# Altium schematic sheet S2_Power.SchDoc
size 420 x 297 mm; SheetNumber: 2; SheetTotal: 7
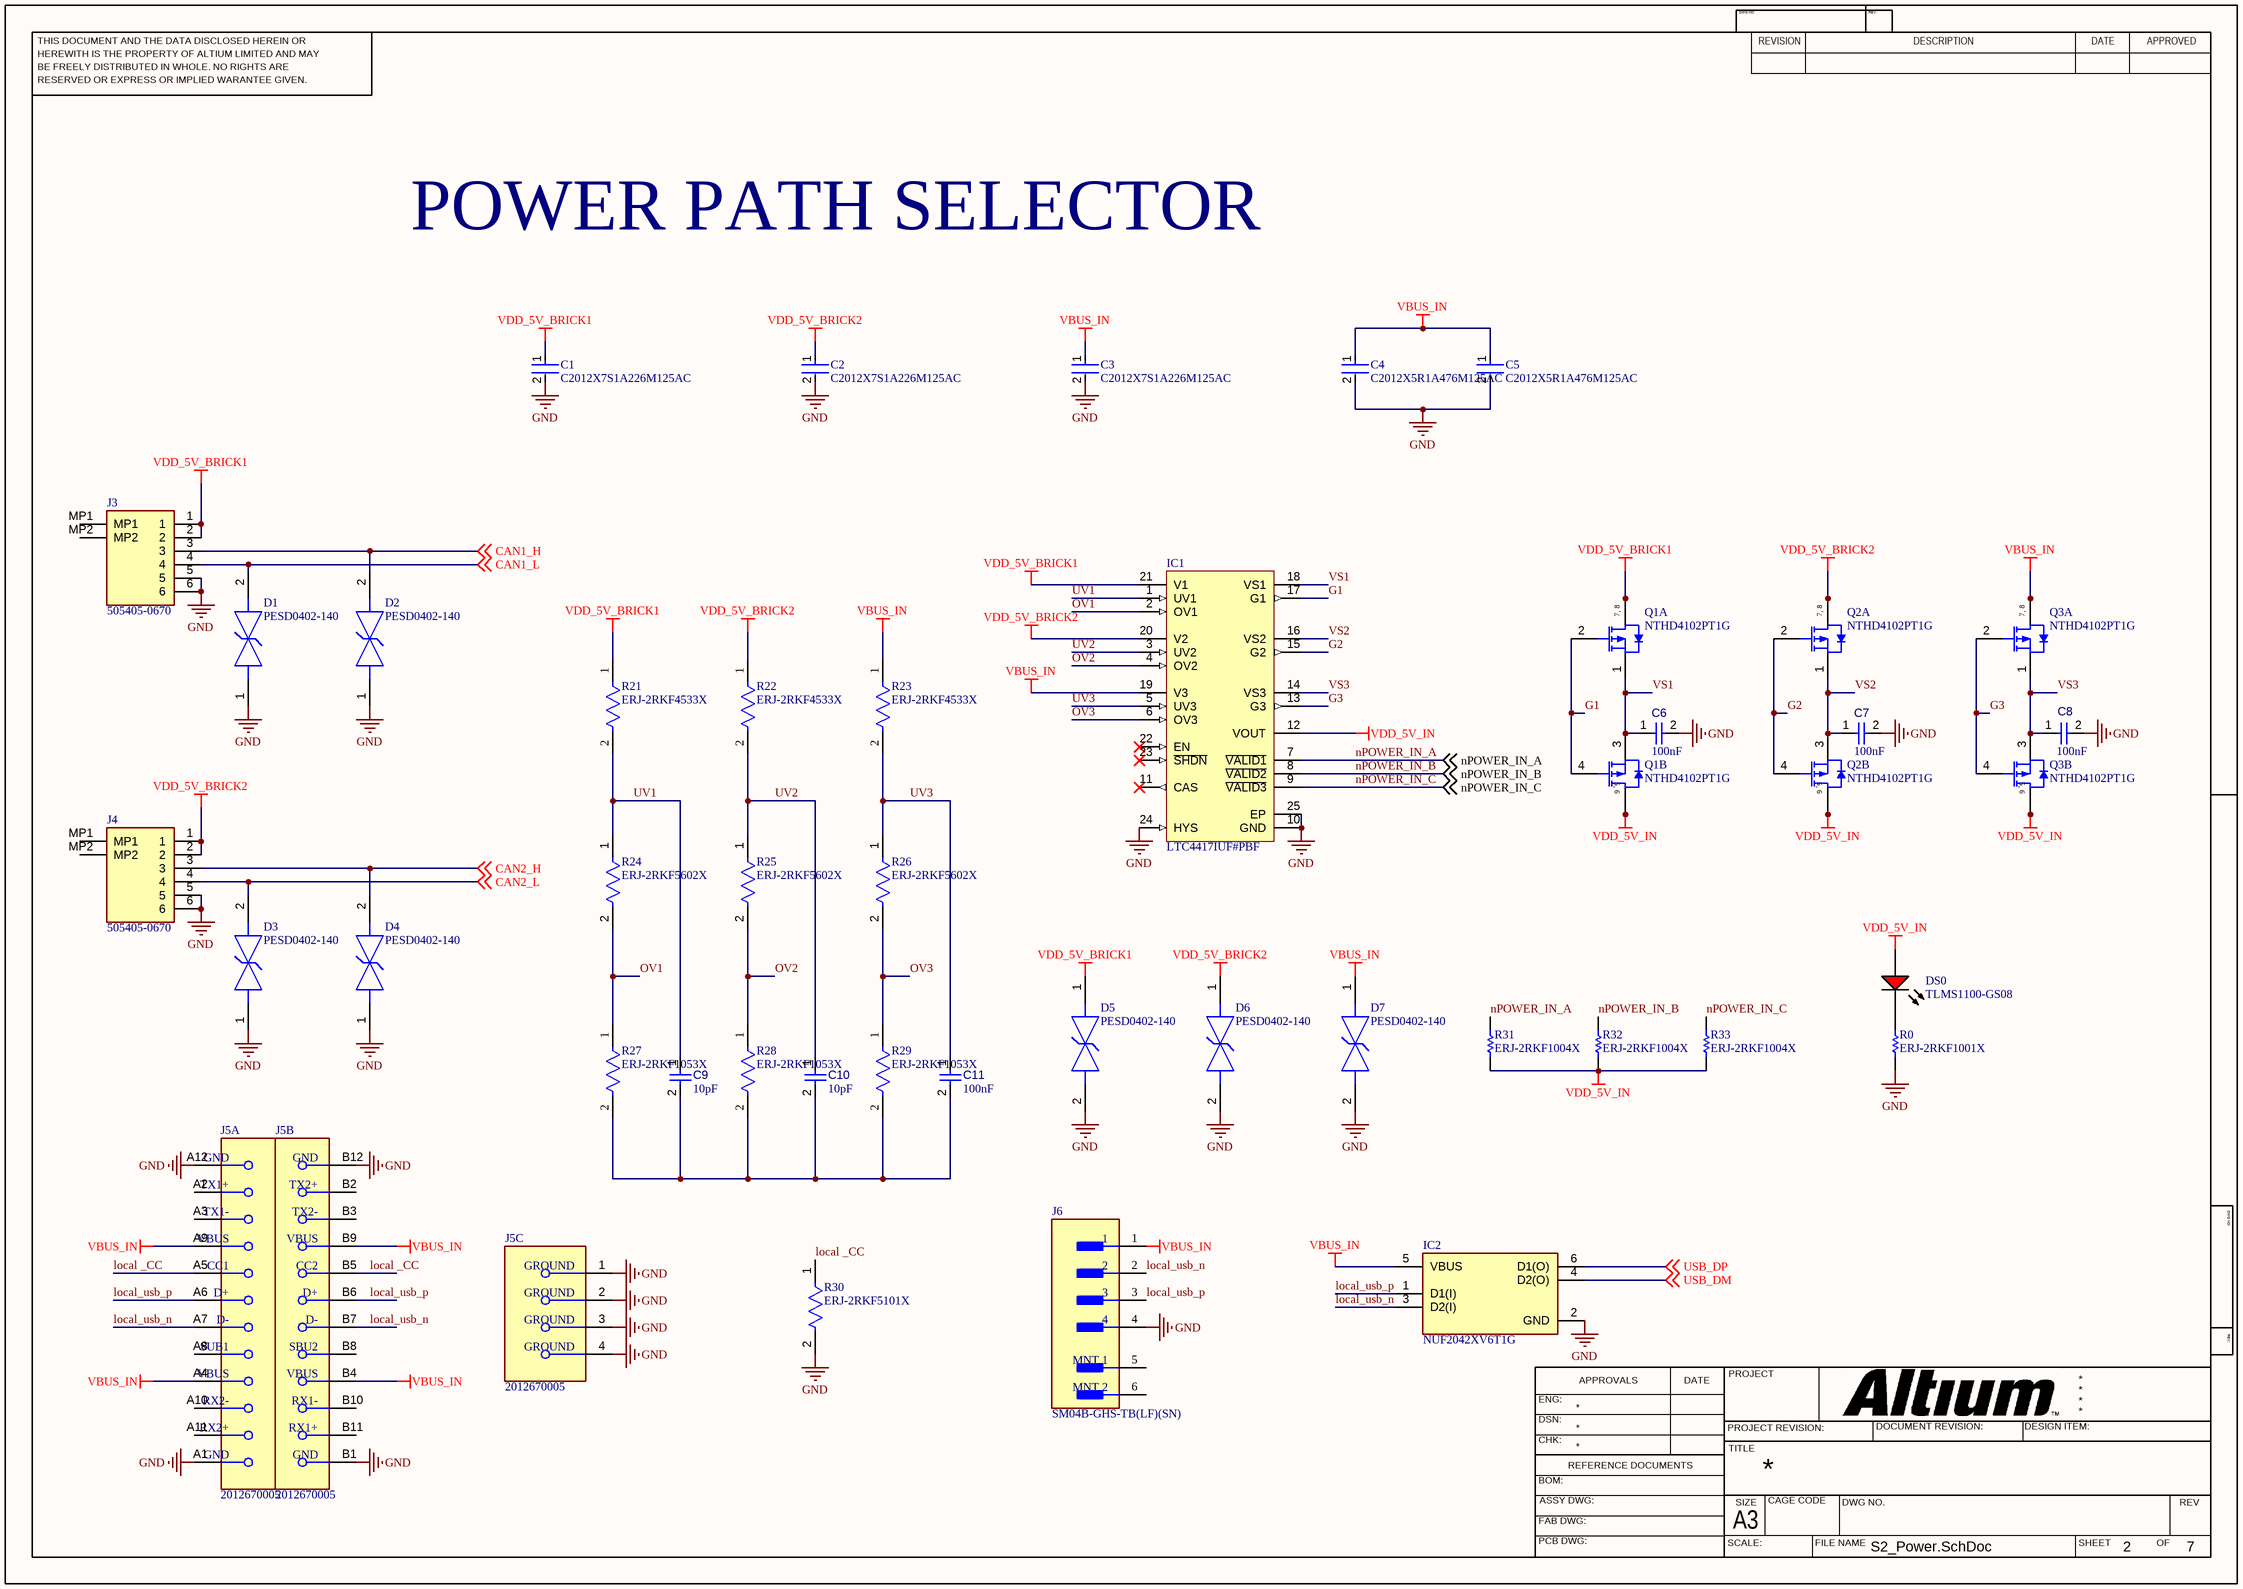
[diagram p0: S2_Power.SchDoc]

## Parts
C1  C2012X7S1A226M125AC  [FP-C2012-125-0_2-IPC_B]
C2  C2012X7S1A226M125AC  [FP-C2012-125-0_2-IPC_B]
C3  C2012X7S1A226M125AC  [FP-C2012-125-0_2-IPC_B]
C4  C2012X5R1A476M125AC  [FP-C2012-125-0_2-IPC_B]
C5  C2012X5R1A476M125AC  [FP-C2012-125-0_2-IPC_B]
C6  value 100nF  [CAPC0402(1005)60_L]  (hidden comment: Capacitor 100nF +/-20% 25V 0402)
C7  value 100nF  [CAPC0402(1005)60_L]  (hidden comment: Capacitor 100nF +/-20% 25V 0402)
C8  value 100nF  [CAPC0402(1005)60_L]  (hidden comment: Capacitor 100nF +/-20% 25V 0402)
C9  value 10pF  [CAPC1608X87X35NL15T15]  (hidden comment: Capacitor 10 pF +/- 0.25 pF 50 V 0603)
C10  value 10pF  [CAPC1608X87X35NL15T15]  (hidden comment: Capacitor 10 pF +/- 0.25 pF 50 V 0603)
C11  value 100nF  [CAPC0402(1005)60_L]  (hidden comment: Capacitor 100nF +/-20% 25V 0402)
D1  PESD0402-140  [FP-PESD0402-MFG]
D2  PESD0402-140  [FP-PESD0402-MFG]
D3  PESD0402-140  [FP-PESD0402-MFG]
D4  PESD0402-140  [FP-PESD0402-MFG]
D5  PESD0402-140  [FP-PESD0402-MFG]
D6  PESD0402-140  [FP-PESD0402-MFG]
D7  PESD0402-140  [FP-PESD0402-MFG]
DS0  TLMS1100-GS08  [VISH-TLMX1100_V]
IC1  LTC4417IUF#PBF  [LT-UF-24_N]
IC2  NUF2042XV6T1G  [FP-463A-MFG]
J3  505405-0670  [5054050670]
J4  505405-0670  [5054050670]
J5  2012670005  [FP-2012670005-MFG]  (parts A,B,C of 3)
J6  SM04B-GHS-TB(LF)(SN)  [FP-SM04B-GHS-TB_LF_SN-MFG]
Q1  NTHD4102PT1G  [ONSC-CHIPFET-8-1206A-03_S2_V]  (parts A,B of 2)
Q2  NTHD4102PT1G  [ONSC-CHIPFET-8-1206A-03_S2_V]  (parts A,B of 2)
Q3  NTHD4102PT1G  [ONSC-CHIPFET-8-1206A-03_S2_V]  (parts A,B of 2)
R0  ERJ-2RKF1001X  [RESC1005X40X25NL05T05]
R21  ERJ-2RKF4533X  [FP-ERJ2RK-MFG]
R22  ERJ-2RKF4533X  [FP-ERJ2RK-MFG]
R23  ERJ-2RKF4533X  [FP-ERJ2RK-MFG]
R24  ERJ-2RKF5602X  [FP-ERJ2R-IPC_A]
R25  ERJ-2RKF5602X  [FP-ERJ2R-IPC_A]
R26  ERJ-2RKF5602X  [FP-ERJ2R-IPC_A]
R27  ERJ-2RKF1053X  [FP-ERJ2RK-MFG]
R28  ERJ-2RKF1053X  [FP-ERJ2RK-MFG]
R29  ERJ-2RKF1053X  [FP-ERJ2RK-MFG]
R30  ERJ-2RKF5101X  [FP-ERJ2RK-IPC_A]
R31  ERJ-2RKF1004X  [RESC1005X40X25LL05T05]
R32  ERJ-2RKF1004X  [RESC1005X40X25LL05T05]
R33  ERJ-2RKF1004X  [RESC1005X40X25LL05T05]

## Nets
GND: C1.2 C2.2 C3.2 C4.2 C5.2 C6.2 C7.2 C8.2 D1.1 D2.1 D3.1 D4.1 D5.2 D6.2 D7.2 IC1.10(GND) IC1.24(HYS) IC1.25(EP) IC2.2(GND) J3.5 J3.6 J4.5 J4.6 J5.1(GROUND) J5.2(GROUND) J5.3(GROUND) J5.4(GROUND) J5.A1(GND) J5.A12(GND) J5.B1(GND) J5.B12(GND) J6.4 R0.1 R30.2
VBUS_IN: C3.1 C4.1 C5.1 D7.1 IC1.19(V3) IC2.5(VBUS) J5.A4(VBUS) J5.A9(VBUS) J5.B4(VBUS) J5.B9(VBUS) J6.1 Q3.7(D1) Q3.8(D1) R23.1
VDD_5V_BRICK1: C1.1 D5.1 IC1.21(V1) J3.1 J3.2 Q1.7(D1) Q1.8(D1) R21.1
VDD_5V_BRICK2: C2.1 D6.1 IC1.20(V2) J4.1 J4.2 Q2.7(D1) Q2.8(D1) R22.1
VDD_5V_IN: DS0.1(A) IC1.12(VOUT) Q1.5(D2) Q1.6(D2) Q2.5(D2) Q2.6(D2) Q3.5(D2) Q3.6(D2) R31.1 R32.1 R33.1
CAN1_H: D2.2 J3.3 ; off-sheet CAN1_H
CAN1_L: D1.2 J3.4 ; off-sheet CAN1_L
CAN2_H: D4.2 J4.3 ; off-sheet CAN2_H
CAN2_L: D3.2 J4.4 ; off-sheet CAN2_L
G1: IC1.17(G1) Q1.2(G1) Q1.4(G2)
G2: IC1.15(G2) Q2.2(G1) Q2.4(G2)
G3: IC1.13(G3) Q3.2(G1) Q3.4(G2)
local _CC: J5.A5(CC1) J5.B5(CC2) R30.1
local_usb_n: IC2.3(D2(I)) J5.A7(D-) J5.B7(D-) J6.2
local_usb_p: IC2.1(D1(I)) J5.A6(D+) J5.B6(D+) J6.3
nPOWER_IN_A: IC1.7(~{VALID1}) R31.2 ; off-sheet nPOWER_IN_A
nPOWER_IN_B: IC1.8(~{VALID2}) R32.2 ; off-sheet nPOWER_IN_B
nPOWER_IN_C: IC1.9(~{VALID3}) R33.2 ; off-sheet nPOWER_IN_C
OV1: IC1.2(OV1) R24.2 R27.1
OV2: IC1.4(OV2) R25.2 R28.1
OV3: IC1.6(OV3) R26.2 R29.1
USB_DM: IC2.4(D2(O)) ; off-sheet USB_DM
USB_DP: IC2.6(D1(O)) ; off-sheet USB_DP
UV1: C9.1 IC1.1(UV1) R21.2 R24.1
UV2: C10.1 IC1.3(UV2) R22.2 R25.1
UV3: C11.1 IC1.5(UV3) R23.2 R26.1
VS1: C6.1 IC1.18(VS1) Q1.1(S1) Q1.3(S2)
VS2: C7.1 IC1.16(VS2) Q2.1(S1) Q2.3(S2)
VS3: C8.1 IC1.14(VS3) Q3.1(S1) Q3.3(S2)
NetC9_2: C9.2 C10.2 C11.2 R27.2 R28.2 R29.2
NetDS0_2: DS0.2(K) R0.2

Not connected (* = marked no-connect by the designer): IC1 11(CAS)* 22(EN)* 23(~{SHDN})*; J3 MP1 MP2; J4 MP1 MP2; J5 A2(TX1+) A3(TX1-) A8(SUB1) A10(RX2-) A11(RX2+) B2(TX2+) B3(TX2-) B8(SBU2) B10(RX1-) B11(RX1+); J6 5(MNT_1) 6(MNT_2)

## Notes on the sheet
- POWER PATH SELECTOR
- THIS DOCUMENT AND THE DATA DISCLOSED HEREIN OR
- HEREWITH IS THE PROPERTY OF ALTIUM LIMITED AND MAY
- DWG NO:
- REVISION
- REV:
- DESCRIPTION
- DATE
- APPROVED
- BE FREELY DISTRIBUTED IN WHOLE. NO RIGHTS ARE
- RESERVED OR EXPRESS OR IMPLIED WARANTEE GIVEN.
- ENG:
- APPROVALS
- PROJECT
- DSN:
- CHK:
- REFERENCE DOCUMENTS
- PROJECT REVISION:
- TITLE
- DOCUMENT REVISION:
- DESIGN ITEM:
- BOM:
- FAB DWG:
- PCB DWG:
- ASSY DWG:
- SCALE:
- A3
- SIZE
- CAGE CODE
- FILE NAME
- DWG NO.
- SHEET
- OF
- REV
- (in symbol CMP-1058-00037-1, part A) 7, 8
- (in symbol CMP-1058-00037-1, part B) 5, 6

## Library data of the parts
C1-C3 = CMP-08246-005250-1: Multilayer Ceramic Capacitors 22μF ±20% 10V X7S SMD 0805; Capacitance: 22uF; Height: 1.25mm; Case Code (Metric): 2012; Mount: Surface Mount; RoHS Compliant: Yes; Dielectric Material: Ceramic; Package Quantity: 2000; Tolerance: 20%; Min Operating Temperature: -55°C; REACH SVHC: No SVHC; Weight: 0.000194oz; Voltage Rating: 10V; Thickness: 0.057inch; Series: C; Termination: SMD/SMT; Length: 0.079inch; Max Operating Temperature: 125°C; Width: 1.25mm; Packaging: Tape and Reel; Dielectric: X7S; Case Code (Imperial): 0805; Voltage Rating (DC): 10V; Lead Free: Lead Free; Case/Package: 0805
C4 C5 = CMP-2000-05451-2: Multilayer Ceramic Capacitors 47μF ±20% 10V X5R SMD 0805; Capacitance: 47uF; RoHS Compliant: Yes; Dielectric: X5R; Case Code (Imperial): 0805; Min Operating Temperature: -55°C; Length: 2mm; Voltage Rating: 10V; Lead Free: Lead Free; Weight: 0.000194oz; Resistor Type: Ceramic; Dielectric Material: Ceramic; Max Operating Temperature: 85°C; Height: 1.25mm; Width: 0.049inch; Depth: 1.25mm; Termination: SMD/SMT; Case/Package: 0805; Voltage Rating (DC): 10V; Voltage: 10V; Thickness: 0.057inch; Tolerance: 20%; REACH SVHC: No SVHC; Package Quantity: 1; Series: C; Case Code (Metric): 2012; Mount: Surface Mount; Packaging: Tape and Reel
C6-C8 C11 = CMP-001-00065-4: Chip Capacitor, 100nF +/-20%, 25V, 0402, Thickness 0.6 mm; Tolerance: 10%; Max Operating Temperature: 85°C; Min Operating Temperature: -55°C; Pins: 2; Voltage Rating: 25V; Mounting Technology: SMT; Case/Package: 0402
C9 C10 = CMP-001-00012-6: Chip Capacitor, 10 pF, +/- 0.25 pF, 50 V, 0603 (1608 Metric); Tolerance: 0.25%; Capacitor Type: Ceramic; Voltage Rating: 50V; Max Operating Temperature: 125°C; RoHS Compliant: True; Mounting Technology: SM; Pins: 2; Case/Package: 0603; Min Operating Temperature: -55°C
D1-D7 = CMP-08607-000011-1: TVS DIODE 14V 40V 0402; Manufacturer: Littelfuse Inc.; Automotive Grade: Grade 1; Capacitance: 0.25pF; Value: 0.25pF; Direction: Bidirectional; Number Of Channels: 1; Temperature Range Low: -55°C; Lead Free: Yes; Temperature: -55°C to +125°C; Digikey Description: TVS DIODE 14V 40V 0402; Automotive: Yes; Device Class L2: TVS Diodes; Reverse Standoff Voltage: 14V; Device Class L1: Circuit Protection; Ipc Land Pattern Name: DIOC10050X33; Manufacturer Part Number: PESD0402-140; Breakdown Voltage: 14V; Height: 0.43mm; Clamping Voltage: 40V; RoHS: TRUE; Temperature Range High: +125°C; Device Class L3: unset; Octopart: https://octopart.com/pesd0402-140-littelfuse-74215061; Package: PESD0402; ComponentLink2URL: https://www.littelfuse.com/~/media/electronics/datasheets/polymer_esd_suppressors/littelfuse_polymer_esd_suppressor_pesd_catalog_datasheet.pdf.pdf; Category: Diode; ComponentLink2Description: Datasheet
DS0 = CMP-1666-00027-1: LED, RED, 2.1 V, -40 to 100 degC, 2-Pin SMD (0603), RoHS, Tape and Reel; Type (Capacitors): C0G; Resistance: 100000000000 Ohm; Capacitance: 12 pF; Voltage Rating: 50 V; Tolerance: 5%; Min Operating Temperature: -55degC; REACH SVHC: No SVHC; ComponentLink2Description: Datasheet; ComponentLink1URL: http://www.vishay.com/; Width: 0.8 mm; Package Quantity: 4000; PackageReference: TLMX1100; ComponentLink2URL: http://www.vishay.com/docs/83173/tlmb1100.pdf; Case/Package: 0603; Case Code (Metric): 1608; Packaging: Tape and Reel; Pins: 2; ComponentLink1Description: Manufacturer URL; Max Operating Temperature: 125degC; Height: 0.8 mm; Length: 1.6 mm; Mount: Surface Mount; PackageDescription: 2-Pin Surface Mount Device, Body 1.6 x 0.8 mm; DatasheetVersion: Rev. 2.7, 03/2016; Case Code (Imperial): 0603; Voltage Rating (DC): 50 V; RoHSCompliant: True; Radiation Hardening: No
IC1 = CMP-0479-00652-1: Prioritized PowerPath Controller, 2.5 to 36 V Vin, 24-pin QFN (UF-24), -40 to 85 degC, Pb-Free; Manufacturer: Linear Technology; Ideal Diode: Triple, External, P-Channel; ComponentLink3URL: http://cds.linear.com/docs/en/packaging/%28UF24%29%20QFN%2005-08-1697%20Rev%20B.pdf; ComponentLink3Description: Package Specification; PartNumber: LTC4417IUF#PBF; PackageVersion: Rev. B, 02/2012; ComponentLink2URL: http://cds.linear.com/docs/en/datasheet/4417f.pdf; PackageReference: UF24; ComponentLink1Description: Manufacturer URL; ComponentLink2Description: Datasheet; PackageDescription: 24-Pin Plastic QFN, Body 4 x 4 mm, Pitch 0.5 mm; ComponentLink1URL: http://www.linear.com/; Code_JEDEC: MO-220; RoHS: TRUE; Mounting Technology: Surface Mount
IC2 = CMP-1066-00027-2: FILTER RC(PI) 22 OHM/42PF SMD; Max DC Current: 100nA; Max Breakdown Voltage: 8V; Direction: Bidirectional; Capacitance: 42pF; Number of Channels: 3; DC Resistance (DCR): 26.4R; ESD Protection: Yes; Length: 0.063inch; Package Quantity: 4000; Case/Package: SOT-563-6; Termination: Gull Wing; Radiation Hardening: No; Lead Free: Lead Free; Halogen Free: Halogen Free; Width: 0.047inch; Min Operating Temperature: -55°C; Packaging: Tape and Reel; Height: 0.024inch; Number of Pins: 6; Max Operating Temperature: 125°C; Contact Plating: Tin; Number of Lines: 3; Depth: 1.7mm
J3 J4 = CMP-002-00078-1: Headers & Wire Housings 1.5 CLIKMate REC WB 6CKT VRT SR GLD PLTG; Manufacturer_Name: Molex; Geometry.Height: 6.35mm; Datasheet Link: https://componentsearchengine.com/Datasheets/1/505405-0670.pdf; Manufacturer_Part_Number: 505405-0670; Mouser Price/Stock: https://www.mouser.co.uk/ProductDetail/Molex/505405-0670?qs=eKig3M7YXu%252B%252BB9S4VwyG6w%3D%3D; Source: 505405-0670.SchLib; Design Item ID: 505405-0670; Mouser Part Number: 538-505405-0670
J5 = CMP-04767-000003-1: CONN RCP USB3.1 TYPEC 24P SMD RA; Manufacturer: Molex; Is Female: yes; Conn Orientation: Right Angle; Shielding: true; Number Of Contacts: 24; Pitch: 0.5mm; Current Rating: 0.25/1.25/5A; Voltage Rating: 30V; Temperature: -40°C to +105°C; ComponentLink2Description: Datasheet; Octopart: https://octopart.com/201267-0005-molex-77836528; Height: 3.86mm; Contact Material: Gold,Nickel; ComponentLink2URL: https://www.molex.com/webdocs/datasheets/pdf/en-us/2012670005_IO_CONNECTORS.pdf; Footprint Url: https://www.molex.com/pdm_docs/sd/2012670005_sd.pdf; Digikey Description: CONN RCP USB3.1 TYPEC 24P SMD RA; Temperature Range High: +105°C; Automotive: No; RoHS: TRUE; Manufacturer Part Number: 2012670005; Device Class L3: unset; Device Class L2: USB Connectors; Category: Conn; Lead Free: Yes; Usb Standard: USB 3.1; Device Class L1: Connectors; Temperature Range Low: -40°C; Package: 2012670005
J6 = CMP-17439-000411-1: CONN HEADER SMD R/A 4POS 1.25MM; Voltage Rating: 50V; Number of Contacts: 4; Current Rating: 1A; Termination: Solder; Mount: Surface Mount; REACH SVHC: No SVHC; Packaging: Cut Tape; Contact Material: Bronze; Series: GH; Orientation: Right Angle; Lead Free: Lead Free; Housing Material: Nylon; Contact Plating: Tin; Housing Color: Natural; Number of Rows: 1; Pitch: 1.25mm; Number of Positions: 4
Q1-Q3 = CMP-1058-00037-1: Power MOSFET, -20 V, -4.1 A, Dual P-Channel, 8-Pin CHIPFET, Pb-Free, Tape and Reel; Manufacturer: On Semiconductor; ID Max (A): 4.1; VGS(th) Max (V): 1.5; Coss Typ (pF): 100; V(BR)DSS Min (V): 20; Ciss Typ (pF): 750; Crss Typ (pF): 45; Qrr Typ (nC): 10; Channel Polarity: P Channel; VGS Max (V): 8; PackageVersion: Rev. E, 10/2004; Mounting Technology: Surface Mount; ComponentLink2URL: http://www.onsemi.com/pub_link/Collateral/NTHD4102P-D.PDF; DatasheetVersion: Rev. 6; ComponentLink1URL: http://www.onsemi.com/; Packing: Tape and Reel; ComponentLink2Description: Datasheet; PackageReference: CHIPFET-8-1206A-03_S2; PackageDescription: 8-Pin ChipFET, Body 3.025 x 1.625 mm, Pitch 0.635 mm; RoHS: Pb-Free; ComponentLink1Description: Manufacturer URL; ComponentLink3Description: Package Specification; Package Type: ChipFET-8; Configuration: Dual; PartNumber: NTHD4102PT1G; ComponentLink3URL: http://www.onsemi.com/pub_link/Collateral/NTHC5513-D.PDF
R0 = CMP-1011-00510-4: Chip Resistor, 1 KOhm, +/- 1%, 100 mW, -55 to 155 degC, 0402 (1005 Metric), RoHS, Tape and Reel; Manufacturer: Basic Passives; Voltage Rating: 50 V; Case\/Package: 0402; Resistance: 1 KOhm; Power Rating: 100 mW; PartNumber: ERJ-2RKF1001X; DatasheetVersion: 04/2015; Radiation Hardening: No; Pins: 2; Height: 0.35 mm; RoHSCompliant: true; Case Code (Imperial): 0402; ComponentLink2Description: Datasheet; ComponentLink1Description: Manufacturer URL; PackageReference: 0402; Mount: Surface Mount; Package Quantity: 10000; Tolerance: 1%; ComponentLink1URL: http://www.panasonic.com/; PackageDescription: 2-Pin Surface Mount Device, Body 1 x 0.5 mm; Mounting Technology: Surface Mount; Case Code (Metric): 1005; ComponentLink2URL: http://industrial.panasonic.com/cdbs/www-data/pdf/RDA0000/AOA0000C86.pdf; REACH SVHC: Yes; Packaging: Tape and Reel; Max Operating Temperature: 155 degC; Min Operating Temperature: -55 degC; Width: 0.5 mm; Length: 1 mm
R21-R23 = CMP-2002-00948-2: NexarPartId: 55421189; Power Rating: 100mW; Resistance: 453kΩ; Temperature Coefficient: 100ppm/°C; Tolerance: 1%; Voltage Rating (DC): 50V; Case Code (Metric): 1005; RoHS: Compliant; Length: 1mm; Case Code (Imperial): 0402; Depth: 500µm; Lead Free: Lead Free; Mount: Surface Mount; Termination: SMD/SMT; Schedule B: 8533210045, 8533210045; Max Operating Temperature: 155°C; Max Power Dissipation: 100mW; Width: 508µm; Case/Package: 0402; Military Standard: Not; Number of Terminations: 2; Contact Plating: Tin; Lifecycle Status: Production; Composition: Thick Film; Min Operating Temperature: -55°C; Height: 350µm; Packaging: Cut Tape; Voltage Rating: 50V; REACH SVHC: Yes
R24-R26 = CMP-2002-01161-3: RES SMD 56K OHM 1% 1/10W 0402; Voltage Rating: 50V; Temperature Coefficient: 100ppm/°C; Power Rating: 100mW; Resistance: 56kR; Case Code (Metric): 1005; Contact Plating: Tin; Series: ERJ; Tolerance: 1%; Min Operating Temperature: -55°C; Resistor Type: Thick Film; Construction: Rectangular; Lead Free: Lead Free; Max Operating Temperature: 155°C; Packaging: Tape and Reel; Length: 1mm; Height: 0.35mm; Voltage Rating (DC): 50V; Number of Terminations: 2; Package Quantity: 10000; Case Code (Imperial): 0402; Depth: 0.5mm; Features: Automotive AEC-Q200; Reach SVHC Compliant: Yes; Radiation Hardening: No; Max Power Dissipation: 100mW; Case/Package: 0402; Technology: THICK FILM; Width: 0.5mm; Resistance Tolerance: 1%; Mount: Surface Mount; Termination: SMD/SMT; Ratings: AEC-Q200; RoHS Compliant: Yes; Number of Pins: 2; Military Standard: Not
R27-R29 = CMP-1011-00738-3: NexarPartId: 55389234; Voltage Rating (DC): 50V; Resistance: 105kΩ; Max Power Dissipation: 100mW; Tolerance: 1%; Temperature Coefficient: 100ppm/°C; Height: 406.4µm; Case Code (Metric): 1005; Schedule B: 8533210045, 8533210045; Radiation Hardening: No; Case Code (Imperial): 0402; Length: 1mm; Lifecycle Status: Production; Width: 500µm; Contact Plating: Tin; Military Standard: Not; Composition: Thick Film; REACH SVHC: No SVHC; Lead Free: Lead Free; Case/Package: 0402; Min Operating Temperature: -55°C; Features: Automotive AEC-Q200; Max Operating Temperature: 155°C; Packaging: Cut Tape; Voltage Rating: 50V; RoHS: Compliant; Power Rating: 100mW; Depth: 500µm; Termination: SMD/SMT; Number of Terminations: 2; Mount: Surface Mount
R30 = CMP-2002-01158-2: RES SMD 5.1K OHM 1% 1/10W 0402; Voltage Rating: 50V; Temperature Coefficient: 100ppm/°C; Resistance: 5.1kR; Power Rating: 100mW; Min Operating Temperature: -55°C; Technology: THICK FILM; Military Standard: Not; Depth: 0.5mm; Contact Plating: Tin; Tolerance: 1%; Construction: Rectangular; Length: 1mm; Case/Package: 0402; Lead Free: Lead Free; RoHS Compliant: Yes; Termination: SMD/SMT; Height: 0.35mm; Max Operating Temperature: 155°C; Case Code (Imperial): 0402; Number of Terminations: 2; Packaging: Tape and Reel; Case Code (Metric): 1005; Width: 0.5mm; Max Power Dissipation: 100mW; Package Quantity: 10000; Resistance Tolerance: 1%; REACH SVHC: No SVHC; Mount: Surface Mount; Series: ERJ; Voltage Rating (DC): 50V; Weight: 2.8E-05oz; Resistor Type: Thick Film
R31-R33 = CMP-2002-00609-3: Chip Resistor, 1 MOhm, +/- 1%, 100 mW, -55 to 155 degC, 0402 (1005 Metric), RoHS, Tape and Reel; Manufacturer: Basic Passives; Voltage Rating: 50 V; Case\/Package: 0402; Resistance: 1 MOhm; Power Rating: 100 mW; Pins: 2; Max Operating Temperature: 155 degC; ComponentLink2URL: http://industrial.panasonic.com/cdbs/www-data/pdf/RDA0000/AOA0000C86.pdf; Weight: 2.8E-05oz; ComponentLink1URL: http://www.panasonic.com/; Radiation Hardening: No; Height: 0.35 mm; Case Code (Imperial): 0402; ComponentLink2Description: Datasheet; Mount: Surface Mount; ComponentLink1Description: Manufacturer URL; REACH SVHC: Yes; PartNumber: ERJ-2RKF1004X; Length: 1 mm; Min Operating Temperature: -55 degC; Width: 0.5 mm; Package Quantity: 10000; Tolerance: 1%; PackageDescription: 2-Pin Surface Mount Device, Body 1 x 0.5 mm; RoHSCompliant: true; DatasheetVersion: 04/2015; PackageReference: 0402; Mounting Technology: Surface Mount; Case Code (Metric): 1005; Packaging: Tape and Reel